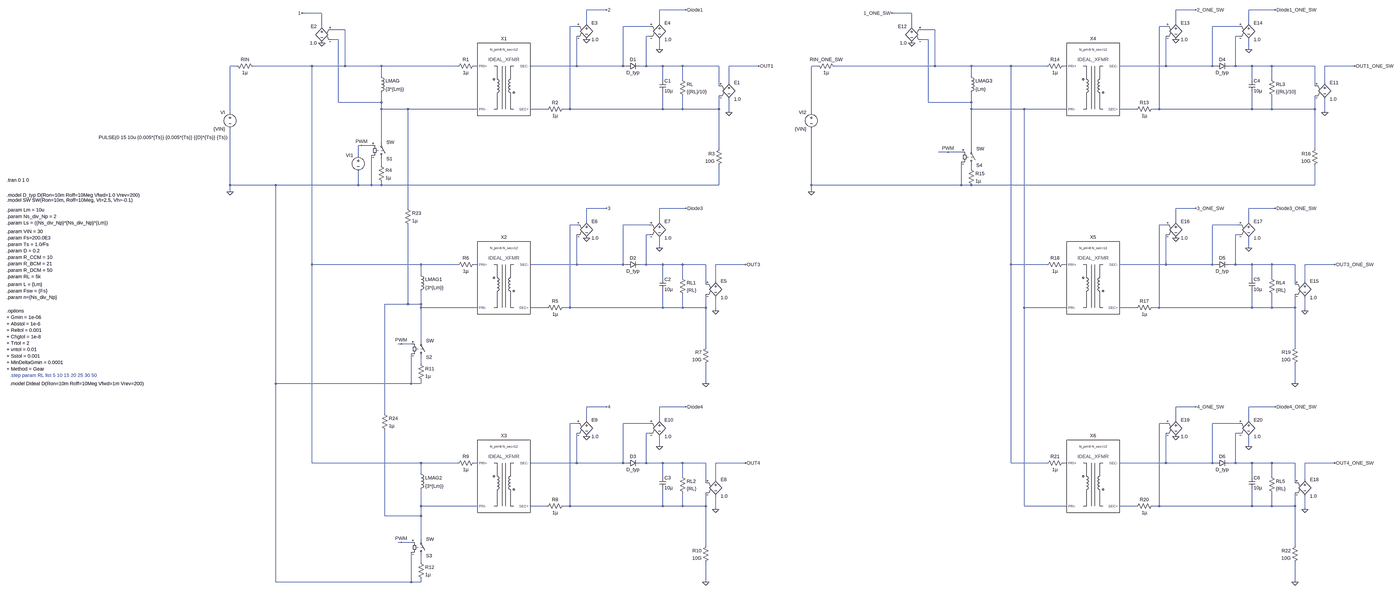
[diagram p0: schematic Flyback_Basic_Model_Multiple_Windings.asc, whole sheet]
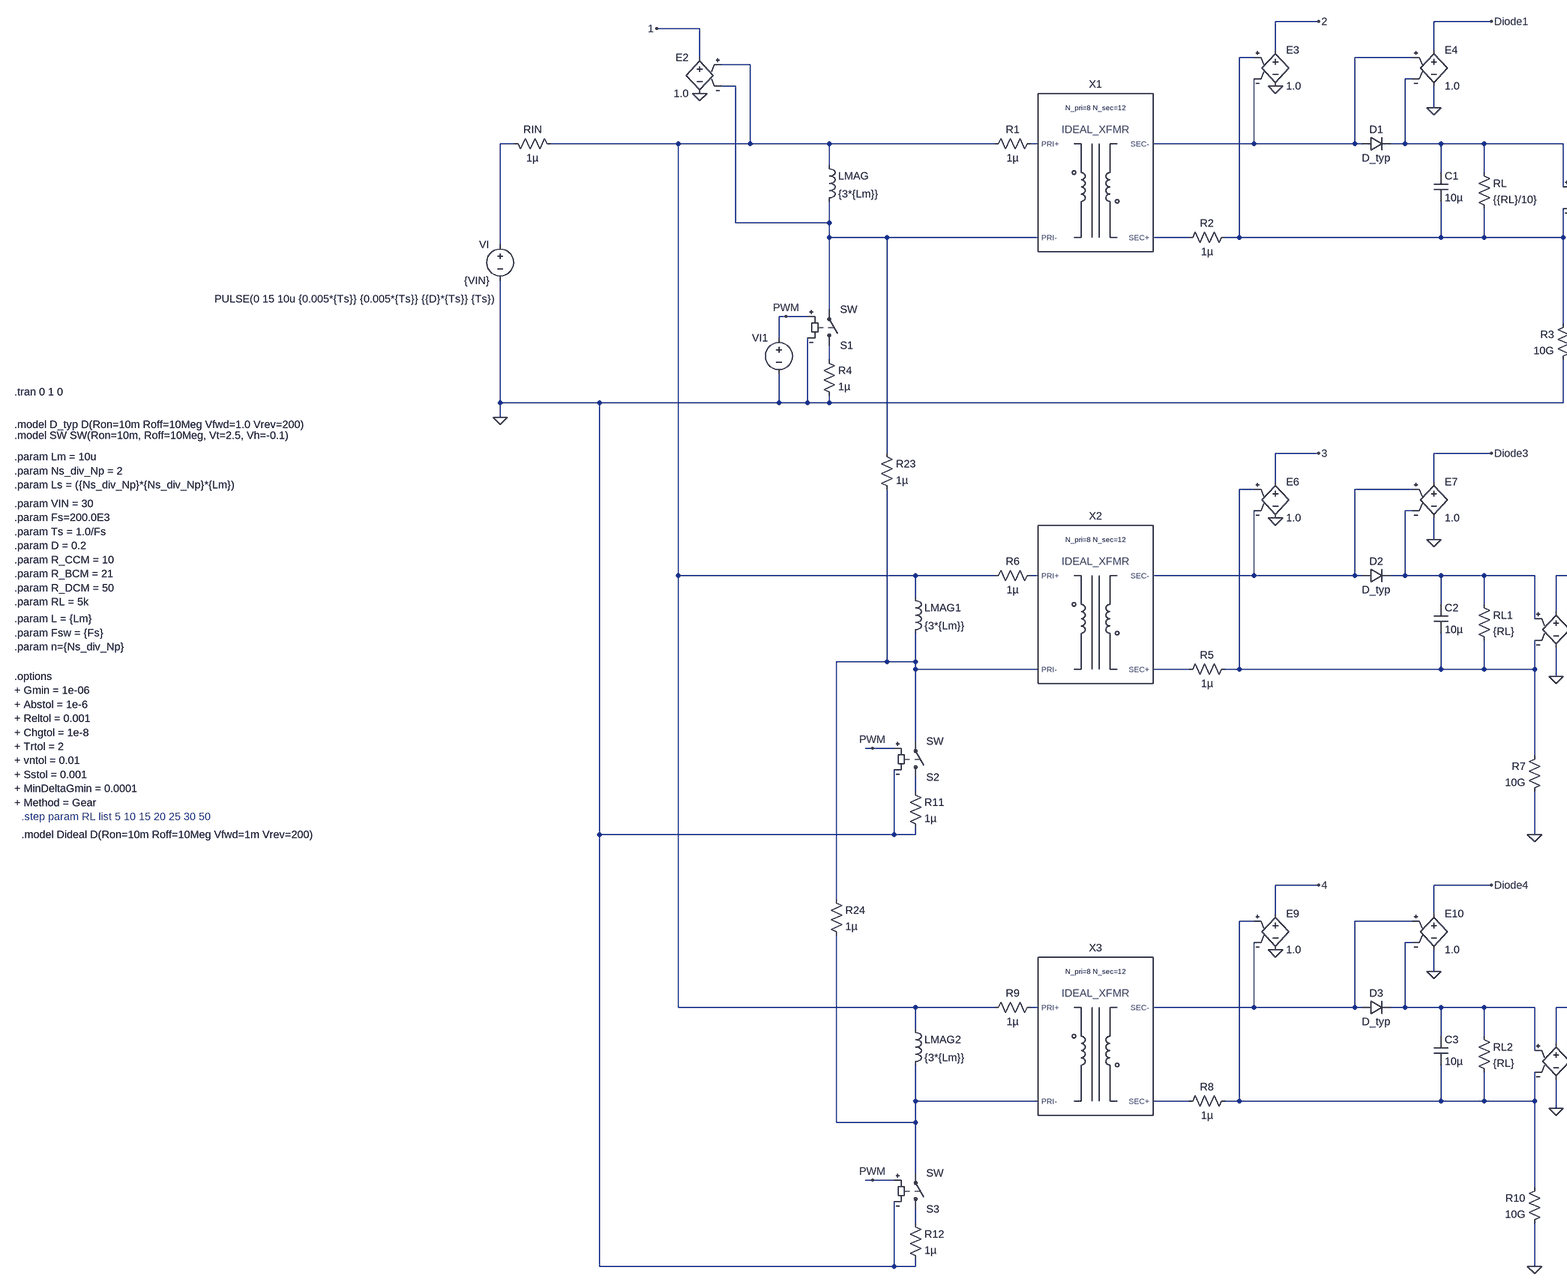
[diagram p1: schematic Flyback_Basic_Model_Multiple_Windings.asc, part, row 1 of 1, column 1 of 2]
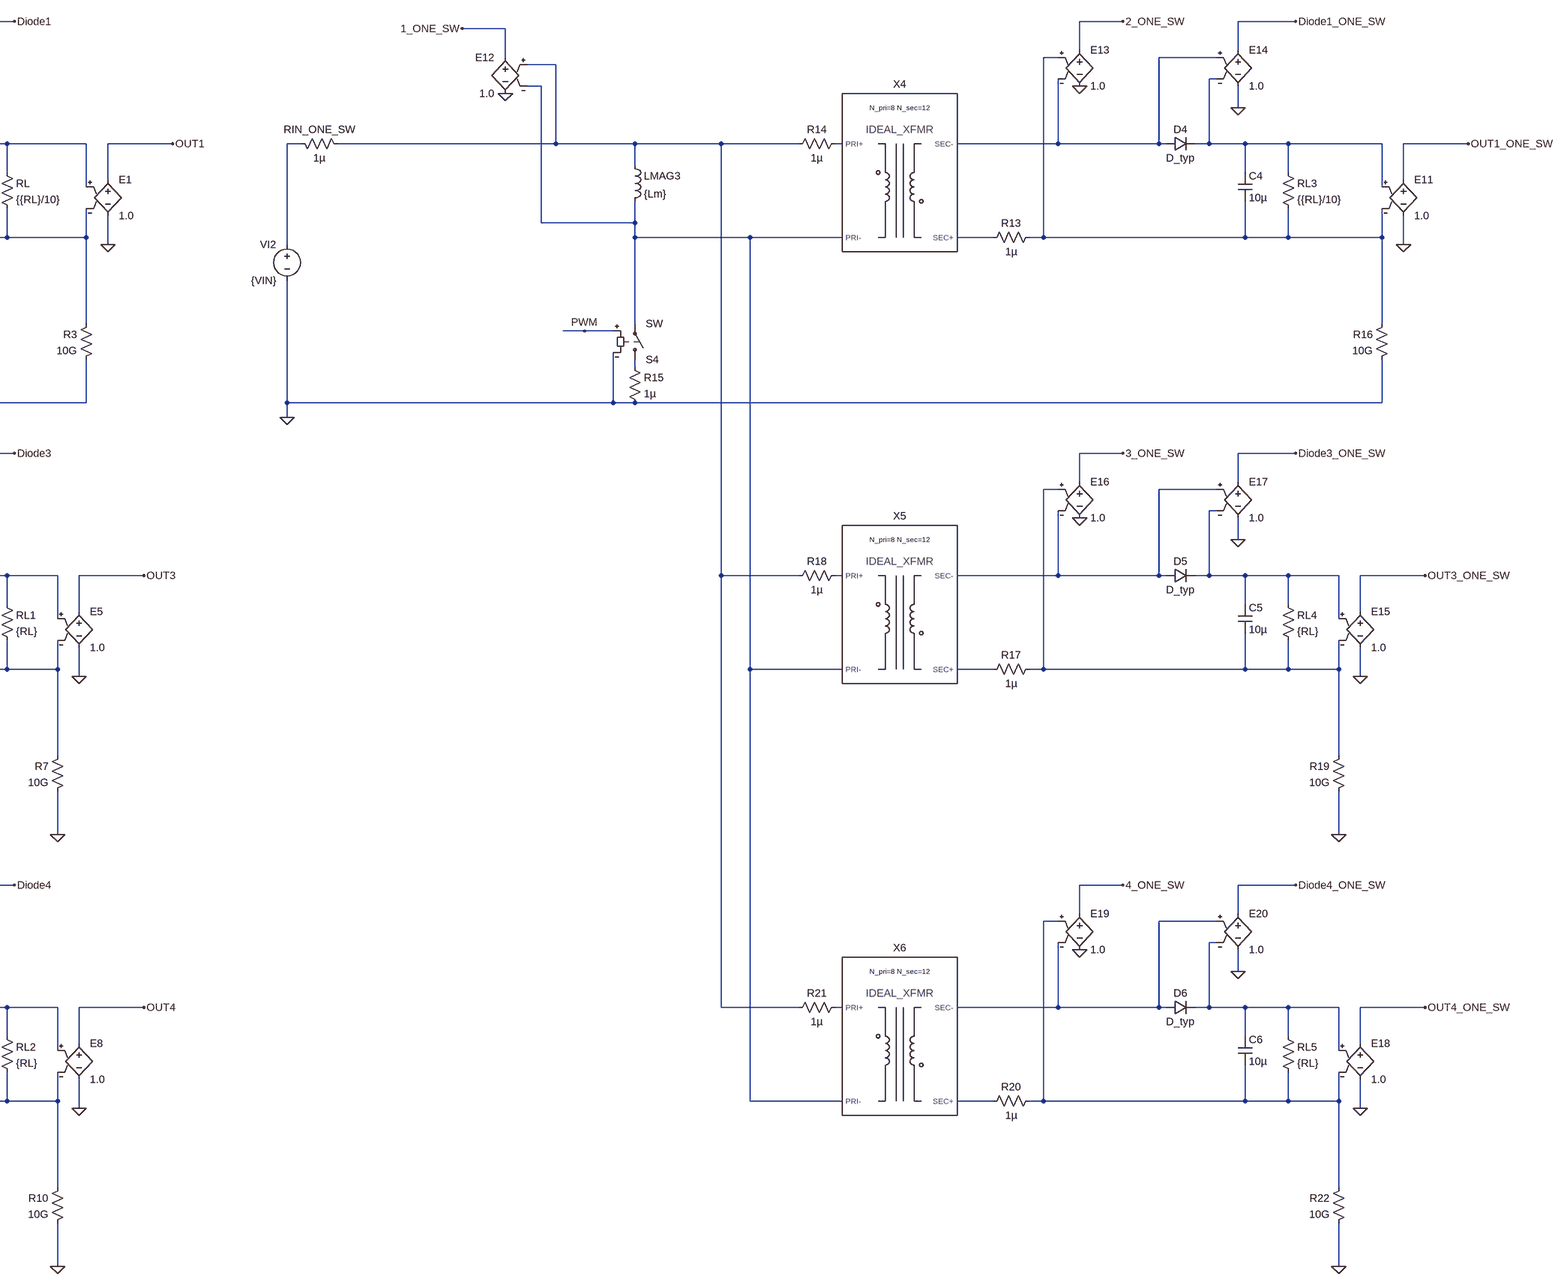
[diagram p2: schematic Flyback_Basic_Model_Multiple_Windings.asc, part, row 1 of 1, column 2 of 2]
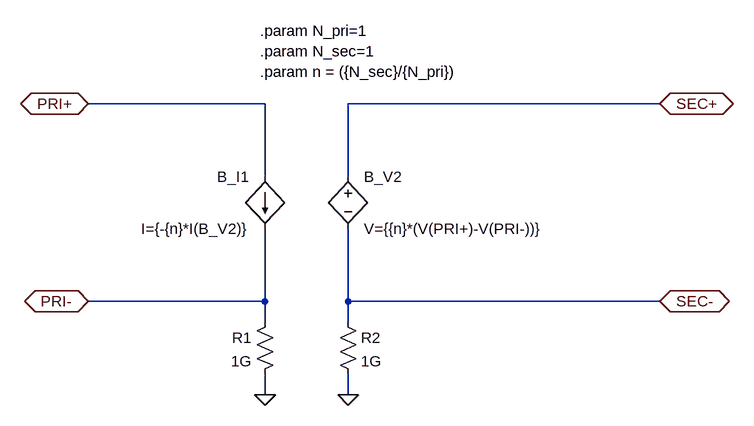
[diagram p3: sub-circuit ideal_dc_xfmr_alt.asc]
Flyback_Basic_Model_Multiple_Windings.asc, the LTspice schematic file:
Version 4.1
SHEET 1 4728 3524
WIRE 800 -288 704 -288
WIRE 1184 -288 1056 -288
WIRE 3760 -288 3664 -288
WIRE 4144 -288 4016 -288
WIRE -576 -272 -672 -272
WIRE 2384 -272 2288 -272
WIRE 704 -224 704 -288
WIRE 1056 -224 1056 -288
WIRE 3664 -224 3664 -288
WIRE 4016 -224 4016 -288
WIRE -576 -208 -576 -272
WIRE 656 -208 624 -208
WIRE 1008 -208 880 -208
WIRE 2384 -208 2384 -272
WIRE 3616 -208 3584 -208
WIRE 3968 -208 3840 -208
WIRE -464 -192 -528 -192
WIRE 2496 -192 2432 -192
WIRE 1008 -160 992 -160
WIRE 3968 -160 3952 -160
WIRE -496 -144 -528 -144
WIRE 2464 -144 2432 -144
WIRE 1056 -96 1056 -144
WIRE 4016 -96 4016 -144
WIRE -1056 -16 -1088 -16
WIRE -624 -16 -976 -16
WIRE -464 -16 -464 -192
WIRE -464 -16 -624 -16
WIRE -288 -16 -464 -16
WIRE 80 -16 -288 -16
WIRE 176 -16 160 -16
WIRE 656 -16 656 -160
WIRE 656 -16 432 -16
WIRE 880 -16 880 -208
WIRE 880 -16 656 -16
WIRE 896 -16 880 -16
WIRE 992 -16 992 -160
WIRE 992 -16 960 -16
WIRE 1072 -16 992 -16
WIRE 1168 -16 1072 -16
WIRE 1344 -16 1168 -16
WIRE 1536 -16 1392 -16
WIRE 1904 -16 1872 -16
WIRE 2496 -16 2496 -192
WIRE 2496 -16 1984 -16
WIRE 2672 -16 2496 -16
WIRE 2864 -16 2672 -16
WIRE 3040 -16 2864 -16
WIRE 3136 -16 3120 -16
WIRE 3616 -16 3616 -160
WIRE 3616 -16 3392 -16
WIRE 3840 -16 3840 -208
WIRE 3840 -16 3616 -16
WIRE 3856 -16 3840 -16
WIRE 3952 -16 3952 -160
WIRE 3952 -16 3920 -16
WIRE 4032 -16 3952 -16
WIRE 4128 -16 4032 -16
WIRE 4336 -16 4128 -16
WIRE 4528 -16 4384 -16
WIRE -288 32 -288 -16
WIRE 2672 32 2672 -16
WIRE 1072 48 1072 -16
WIRE 1168 48 1168 -16
WIRE 4032 48 4032 -16
WIRE 4128 48 4128 -16
WIRE 1392 64 1392 -16
WIRE 4384 64 4384 -16
WIRE 1344 80 1344 -16
WIRE 4336 80 4336 -16
WIRE -496 160 -496 -144
WIRE -288 160 -288 112
WIRE -288 160 -496 160
WIRE 2464 160 2464 -144
WIRE 2672 160 2672 112
WIRE 2672 160 2464 160
WIRE -288 192 -288 160
WIRE -160 192 -288 192
WIRE 176 192 -160 192
WIRE 512 192 432 192
WIRE 624 192 624 -208
WIRE 624 192 592 192
WIRE 1072 192 1072 112
WIRE 1072 192 624 192
WIRE 1168 192 1168 128
WIRE 1168 192 1072 192
WIRE 1344 192 1344 128
WIRE 1344 192 1168 192
WIRE 2672 192 2672 160
WIRE 2928 192 2672 192
WIRE 3136 192 2928 192
WIRE 3472 192 3392 192
WIRE 3584 192 3584 -208
WIRE 3584 192 3552 192
WIRE 4032 192 4032 112
WIRE 4032 192 3584 192
WIRE 4128 192 4128 128
WIRE 4128 192 4032 192
WIRE 4336 192 4336 128
WIRE 4336 192 4128 192
WIRE -1088 208 -1088 -16
WIRE 1392 208 1392 144
WIRE 1872 208 1872 -16
WIRE 4384 208 4384 144
WIRE -288 352 -288 192
WIRE -384 368 -400 368
WIRE -336 368 -384 368
WIRE 1344 384 1344 192
WIRE 2672 384 2672 192
WIRE 4336 384 4336 192
WIRE 2560 400 2512 400
WIRE 2624 400 2560 400
WIRE -400 416 -400 368
WIRE -288 464 -288 432
WIRE 2672 480 2672 464
WIRE -1088 560 -1088 288
WIRE -864 560 -1088 560
WIRE -400 560 -400 496
WIRE -400 560 -864 560
WIRE -336 560 -336 416
WIRE -336 560 -400 560
WIRE -288 560 -288 544
WIRE -288 560 -336 560
WIRE 1344 560 1344 464
WIRE 1344 560 -288 560
WIRE 1872 560 1872 288
WIRE 2624 560 2624 448
WIRE 2624 560 1872 560
WIRE 2672 560 2624 560
WIRE 4336 560 4336 464
WIRE 4336 560 2672 560
WIRE -1088 592 -1088 560
WIRE 1872 592 1872 560
WIRE -160 672 -160 192
WIRE 800 672 704 672
WIRE 1184 672 1056 672
WIRE 3760 672 3664 672
WIRE 4144 672 4016 672
WIRE 704 736 704 672
WIRE 1056 736 1056 672
WIRE 3664 736 3664 672
WIRE 4016 736 4016 672
WIRE 656 752 624 752
WIRE 1008 752 880 752
WIRE 3616 752 3584 752
WIRE 3968 752 3840 752
WIRE 1008 800 992 800
WIRE 3968 800 3952 800
WIRE 1056 864 1056 816
WIRE 4016 864 4016 816
WIRE -624 944 -624 -16
WIRE -96 944 -624 944
WIRE 80 944 -96 944
WIRE 176 944 160 944
WIRE 656 944 656 800
WIRE 656 944 432 944
WIRE 880 944 880 752
WIRE 880 944 656 944
WIRE 896 944 880 944
WIRE 992 944 992 800
WIRE 992 944 960 944
WIRE 1072 944 992 944
WIRE 1168 944 1072 944
WIRE 1280 944 1168 944
WIRE 1472 944 1328 944
WIRE 2864 944 2864 -16
WIRE 3040 944 2864 944
WIRE 3136 944 3120 944
WIRE 3616 944 3616 800
WIRE 3616 944 3392 944
WIRE 3840 944 3840 752
WIRE 3840 944 3616 944
WIRE 3856 944 3840 944
WIRE 3952 944 3952 800
WIRE 3952 944 3920 944
WIRE 4032 944 3952 944
WIRE 4128 944 4032 944
WIRE 4240 944 4128 944
WIRE 4432 944 4288 944
WIRE -96 992 -96 944
WIRE 1072 1008 1072 944
WIRE 1168 1008 1168 944
WIRE 4032 1008 4032 944
WIRE 4128 1008 4128 944
WIRE 1328 1024 1328 944
WIRE 4288 1024 4288 944
WIRE 1280 1040 1280 944
WIRE 4240 1040 4240 944
WIRE -160 1136 -160 752
WIRE -160 1136 -272 1136
WIRE -96 1136 -96 1072
WIRE -96 1136 -160 1136
WIRE -96 1152 -96 1136
WIRE 176 1152 -96 1152
WIRE 512 1152 432 1152
WIRE 624 1152 624 752
WIRE 624 1152 592 1152
WIRE 1072 1152 1072 1072
WIRE 1072 1152 624 1152
WIRE 1168 1152 1168 1088
WIRE 1168 1152 1072 1152
WIRE 1280 1152 1280 1088
WIRE 1280 1152 1168 1152
WIRE 2928 1152 2928 192
WIRE 3136 1152 2928 1152
WIRE 3472 1152 3392 1152
WIRE 3584 1152 3584 752
WIRE 3584 1152 3552 1152
WIRE 4032 1152 4032 1072
WIRE 4032 1152 3584 1152
WIRE 4128 1152 4128 1088
WIRE 4128 1152 4032 1152
WIRE 4240 1152 4240 1088
WIRE 4240 1152 4128 1152
WIRE 1328 1168 1328 1104
WIRE 4288 1168 4288 1104
WIRE -96 1312 -96 1152
WIRE -192 1328 -208 1328
WIRE -144 1328 -192 1328
WIRE 1280 1344 1280 1152
WIRE 4240 1344 4240 1152
WIRE -96 1424 -96 1392
WIRE -864 1520 -864 560
WIRE -144 1520 -144 1376
WIRE -144 1520 -864 1520
WIRE -96 1520 -96 1504
WIRE -96 1520 -144 1520
WIRE 1280 1520 1280 1424
WIRE 4240 1520 4240 1424
WIRE 800 1632 704 1632
WIRE 1184 1632 1056 1632
WIRE 3760 1632 3664 1632
WIRE 4144 1632 4016 1632
WIRE -272 1664 -272 1136
WIRE 704 1696 704 1632
WIRE 1056 1696 1056 1632
WIRE 3664 1696 3664 1632
WIRE 4016 1696 4016 1632
WIRE 656 1712 624 1712
WIRE 1008 1712 880 1712
WIRE 3616 1712 3584 1712
WIRE 3968 1712 3840 1712
WIRE 1008 1760 992 1760
WIRE 3968 1760 3952 1760
WIRE 1056 1824 1056 1776
WIRE 4016 1824 4016 1776
WIRE -624 1904 -624 944
WIRE -96 1904 -624 1904
WIRE 80 1904 -96 1904
WIRE 176 1904 160 1904
WIRE 656 1904 656 1760
WIRE 656 1904 432 1904
WIRE 880 1904 880 1712
WIRE 880 1904 656 1904
WIRE 896 1904 880 1904
WIRE 992 1904 992 1760
WIRE 992 1904 960 1904
WIRE 1072 1904 992 1904
WIRE 1168 1904 1072 1904
WIRE 1280 1904 1168 1904
WIRE 1472 1904 1328 1904
WIRE 2864 1904 2864 944
WIRE 3040 1904 2864 1904
WIRE 3136 1904 3120 1904
WIRE 3616 1904 3616 1760
WIRE 3616 1904 3392 1904
WIRE 3840 1904 3840 1712
WIRE 3840 1904 3616 1904
WIRE 3856 1904 3840 1904
WIRE 3952 1904 3952 1760
WIRE 3952 1904 3920 1904
WIRE 4032 1904 3952 1904
WIRE 4128 1904 4032 1904
WIRE 4240 1904 4128 1904
WIRE 4432 1904 4288 1904
WIRE -96 1952 -96 1904
WIRE 1072 1968 1072 1904
WIRE 1168 1968 1168 1904
WIRE 4032 1968 4032 1904
WIRE 4128 1968 4128 1904
WIRE 1328 1984 1328 1904
WIRE 4288 1984 4288 1904
WIRE 1280 2000 1280 1904
WIRE 4240 2000 4240 1904
WIRE -96 2112 -96 2032
WIRE 176 2112 -96 2112
WIRE 512 2112 432 2112
WIRE 624 2112 624 1712
WIRE 624 2112 592 2112
WIRE 1072 2112 1072 2032
WIRE 1072 2112 624 2112
WIRE 1168 2112 1168 2048
WIRE 1168 2112 1072 2112
WIRE 1280 2112 1280 2048
WIRE 1280 2112 1168 2112
WIRE 2928 2112 2928 1152
WIRE 3136 2112 2928 2112
WIRE 3472 2112 3392 2112
WIRE 3584 2112 3584 1712
WIRE 3584 2112 3552 2112
WIRE 4032 2112 4032 2032
WIRE 4032 2112 3584 2112
WIRE 4128 2112 4128 2048
WIRE 4128 2112 4032 2112
WIRE 4240 2112 4240 2048
WIRE 4240 2112 4128 2112
WIRE 1328 2128 1328 2064
WIRE 4288 2128 4288 2064
WIRE -272 2160 -272 1744
WIRE -96 2160 -96 2112
WIRE -96 2160 -272 2160
WIRE -96 2272 -96 2160
WIRE -192 2288 -208 2288
WIRE -144 2288 -192 2288
WIRE 1280 2304 1280 2112
WIRE 4240 2304 4240 2112
WIRE -96 2384 -96 2352
WIRE -864 2480 -864 1520
WIRE -144 2480 -144 2336
WIRE -144 2480 -864 2480
WIRE -96 2480 -96 2464
WIRE -96 2480 -144 2480
WIRE 1280 2480 1280 2384
WIRE 4240 2480 4240 2384
FLAG -1088 592 0
FLAG 1392 208 0
FLAG 1536 -16 OUT1
FLAG -576 -128 0
FLAG 704 -144 0
FLAG -672 -272 1
FLAG 800 -288 2
FLAG 1056 -96 0
FLAG 1184 -288 Diode1
FLAG -384 368 PWM
FLAG 1328 1168 0
FLAG 1472 944 OUT3
FLAG 704 816 0
FLAG 800 672 3
FLAG 1056 864 0
FLAG 1184 672 Diode3
FLAG 1328 2128 0
FLAG 1472 1904 OUT4
FLAG 704 1776 0
FLAG 800 1632 4
FLAG 1056 1824 0
FLAG 1184 1632 Diode4
FLAG 1280 1520 0
FLAG 1280 2480 0
FLAG -192 1328 PWM
FLAG -192 2288 PWM
FLAG 1872 592 0
FLAG 4384 208 0
FLAG 4528 -16 OUT1_ONE_SW
FLAG 2384 -128 0
FLAG 3664 -144 0
FLAG 2288 -272 1_ONE_SW
FLAG 3760 -288 2_ONE_SW
FLAG 4016 -96 0
FLAG 4144 -288 Diode1_ONE_SW
FLAG 4288 1168 0
FLAG 4432 944 OUT3_ONE_SW
FLAG 3664 816 0
FLAG 3760 672 3_ONE_SW
FLAG 4016 864 0
FLAG 4144 672 Diode3_ONE_SW
FLAG 4288 2128 0
FLAG 4432 1904 OUT4_ONE_SW
FLAG 3664 1776 0
FLAG 3760 1632 4_ONE_SW
FLAG 4016 1824 0
FLAG 4144 1632 Diode4_ONE_SW
FLAG 4240 1520 0
FLAG 4240 2480 0
FLAG 2560 400 PWM
SYMBOL voltage -1088 192 M0
WINDOW 123 0 0 Left 0
WINDOW 39 0 0 Left 0
SYMATTR InstName VI
SYMATTR Value {VIN}
SYMBOL voltage -400 400 M0
WINDOW 123 0 0 Left 0
WINDOW 39 0 0 Left 0
WINDOW 3 701 -71 Left 2
SYMATTR Value PULSE(0 15 10u {0.005*{Ts}} {0.005*{Ts}} {{D}*{Ts}} {Ts})
SYMATTR InstName VI1
SYMBOL res 1152 32 R0
SYMATTR InstName RL
SYMATTR Value {{RL}/10}
SYMBOL cap 1056 48 R0
SYMATTR InstName C1
SYMATTR Value 10µ
SYMBOL diode 896 0 R270
WINDOW 0 32 32 VTop 2
WINDOW 3 0 32 VBottom 2
SYMATTR InstName D1
SYMATTR Value D_typ
SYMBOL e 1392 48 R0
SYMATTR InstName E1
SYMATTR Value 1.0
SYMBOL res 608 176 R90
WINDOW 0 0 56 VBottom 2
WINDOW 3 32 56 VTop 2
SYMATTR InstName R2
SYMATTR Value 1µ
SYMBOL res 64 0 R270
WINDOW 0 32 56 VTop 2
WINDOW 3 0 56 VBottom 2
SYMATTR InstName R1
SYMATTR Value 1µ
SYMBOL e -576 -224 M0
SYMATTR InstName E2
SYMATTR Value 1.0
SYMBOL e 704 -240 R0
SYMATTR InstName E3
SYMATTR Value 1.0
SYMBOL sw -288 448 M180
SYMATTR InstName S1
SYMBOL res -304 448 R0
SYMATTR InstName R4
SYMATTR Value 1µ
SYMBOL e 1056 -240 R0
SYMATTR InstName E4
SYMATTR Value 1.0
SYMBOL IDEAL_DC_XFMR_ALT 304 80 R0
WINDOW 39 0 -176 Center 1
SYMATTR SpiceLine N_pri=8 N_sec=12
SYMATTR InstName X1
SYMBOL ind -304 16 R0
SYMATTR InstName LMAG
SYMATTR Value {3*{Lm}}
SYMBOL res 1360 368 M0
SYMATTR InstName R3
SYMATTR Value 10G
SYMBOL res 1152 992 R0
SYMATTR InstName RL1
SYMATTR Value {RL}
SYMBOL cap 1056 1008 R0
SYMATTR InstName C2
SYMATTR Value 10µ
SYMBOL diode 896 960 R270
WINDOW 0 32 32 VTop 2
WINDOW 3 0 32 VBottom 2
SYMATTR InstName D2
SYMATTR Value D_typ
SYMBOL e 1328 1008 R0
SYMATTR InstName E5
SYMATTR Value 1.0
SYMBOL res 608 1136 R90
WINDOW 0 0 56 VBottom 2
WINDOW 3 32 56 VTop 2
SYMATTR InstName R5
SYMATTR Value 1µ
SYMBOL res 64 960 R270
WINDOW 0 32 56 VTop 2
WINDOW 3 0 56 VBottom 2
SYMATTR InstName R6
SYMATTR Value 1µ
SYMBOL e 704 720 R0
SYMATTR InstName E6
SYMATTR Value 1.0
SYMBOL e 1056 720 R0
SYMATTR InstName E7
SYMATTR Value 1.0
SYMBOL IDEAL_DC_XFMR_ALT 304 1040 R0
WINDOW 39 0 -176 Center 1
SYMATTR SpiceLine N_pri=8 N_sec=12
SYMATTR InstName X2
SYMBOL res 1296 1328 M0
SYMATTR InstName R7
SYMATTR Value 10G
SYMBOL res 1152 1952 R0
SYMATTR InstName RL2
SYMATTR Value {RL}
SYMBOL cap 1056 1968 R0
SYMATTR InstName C3
SYMATTR Value 10µ
SYMBOL diode 896 1920 R270
WINDOW 0 32 32 VTop 2
WINDOW 3 0 32 VBottom 2
SYMATTR InstName D3
SYMATTR Value D_typ
SYMBOL e 1328 1968 R0
SYMATTR InstName E8
SYMATTR Value 1.0
SYMBOL res 608 2096 R90
WINDOW 0 0 56 VBottom 2
WINDOW 3 32 56 VTop 2
SYMATTR InstName R8
SYMATTR Value 1µ
SYMBOL res 64 1920 R270
WINDOW 0 32 56 VTop 2
WINDOW 3 0 56 VBottom 2
SYMATTR InstName R9
SYMATTR Value 1µ
SYMBOL e 704 1680 R0
SYMATTR InstName E9
SYMATTR Value 1.0
SYMBOL e 1056 1680 R0
SYMATTR InstName E10
SYMATTR Value 1.0
SYMBOL IDEAL_DC_XFMR_ALT 304 2000 R0
WINDOW 39 0 -176 Center 1
SYMATTR SpiceLine N_pri=8 N_sec=12
SYMATTR InstName X3
SYMBOL res 1296 2288 M0
SYMATTR InstName R10
SYMATTR Value 10G
SYMBOL sw -96 1408 M180
SYMATTR InstName S2
SYMBOL res -112 1408 R0
SYMATTR InstName R11
SYMATTR Value 1µ
SYMBOL ind -112 976 R0
SYMATTR InstName LMAG1
SYMATTR Value {3*{Lm}}
SYMBOL sw -96 2368 M180
SYMATTR InstName S3
SYMBOL res -112 2368 R0
SYMATTR InstName R12
SYMATTR Value 1µ
SYMBOL ind -112 1936 R0
SYMATTR InstName LMAG2
SYMATTR Value {3*{Lm}}
SYMBOL res -1072 -32 M90
WINDOW 0 0 56 VBottom 2
WINDOW 3 32 56 VTop 2
SYMATTR InstName RIN
SYMATTR Value 1µ
SYMBOL voltage 1872 192 M0
WINDOW 123 0 0 Left 0
WINDOW 39 0 0 Left 0
SYMATTR InstName VI2
SYMATTR Value {VIN}
SYMBOL res 4112 32 R0
SYMATTR InstName RL3
SYMATTR Value {{RL}/10}
SYMBOL cap 4016 48 R0
SYMATTR InstName C4
SYMATTR Value 10µ
SYMBOL diode 3856 0 R270
WINDOW 0 32 32 VTop 2
WINDOW 3 0 32 VBottom 2
SYMATTR InstName D4
SYMATTR Value D_typ
SYMBOL e 4384 48 R0
SYMATTR InstName E11
SYMATTR Value 1.0
SYMBOL res 3568 176 R90
WINDOW 0 0 56 VBottom 2
WINDOW 3 32 56 VTop 2
SYMATTR InstName R13
SYMATTR Value 1µ
SYMBOL res 3024 0 R270
WINDOW 0 32 56 VTop 2
WINDOW 3 0 56 VBottom 2
SYMATTR InstName R14
SYMATTR Value 1µ
SYMBOL e 2384 -224 M0
SYMATTR InstName E12
SYMATTR Value 1.0
SYMBOL e 3664 -240 R0
SYMATTR InstName E13
SYMATTR Value 1.0
SYMBOL sw 2672 480 M180
SYMATTR InstName S4
SYMBOL res 2656 464 R0
SYMATTR InstName R15
SYMATTR Value 1µ
SYMBOL e 4016 -240 R0
SYMATTR InstName E14
SYMATTR Value 1.0
SYMBOL IDEAL_DC_XFMR_ALT 3264 80 R0
WINDOW 39 0 -176 Center 1
SYMATTR SpiceLine N_pri=8 N_sec=12
SYMATTR InstName X4
SYMBOL ind 2656 16 R0
SYMATTR InstName LMAG3
SYMATTR Value {Lm}
SYMATTR SpiceLine Rser=1m
SYMBOL res 4352 368 M0
SYMATTR InstName R16
SYMATTR Value 10G
SYMBOL res 4112 992 R0
SYMATTR InstName RL4
SYMATTR Value {RL}
SYMBOL cap 4016 1008 R0
SYMATTR InstName C5
SYMATTR Value 10µ
SYMBOL diode 3856 960 R270
WINDOW 0 32 32 VTop 2
WINDOW 3 0 32 VBottom 2
SYMATTR InstName D5
SYMATTR Value D_typ
SYMBOL e 4288 1008 R0
SYMATTR InstName E15
SYMATTR Value 1.0
SYMBOL res 3568 1136 R90
WINDOW 0 0 56 VBottom 2
WINDOW 3 32 56 VTop 2
SYMATTR InstName R17
SYMATTR Value 1µ
SYMBOL res 3024 960 R270
WINDOW 0 32 56 VTop 2
WINDOW 3 0 56 VBottom 2
SYMATTR InstName R18
SYMATTR Value 1µ
SYMBOL e 3664 720 R0
SYMATTR InstName E16
SYMATTR Value 1.0
SYMBOL e 4016 720 R0
SYMATTR InstName E17
SYMATTR Value 1.0
SYMBOL IDEAL_DC_XFMR_ALT 3264 1040 R0
WINDOW 39 0 -176 Center 1
SYMATTR SpiceLine N_pri=8 N_sec=12
SYMATTR InstName X5
SYMBOL res 4256 1328 M0
SYMATTR InstName R19
SYMATTR Value 10G
SYMBOL res 4112 1952 R0
SYMATTR InstName RL5
SYMATTR Value {RL}
SYMBOL cap 4016 1968 R0
SYMATTR InstName C6
SYMATTR Value 10µ
SYMBOL diode 3856 1920 R270
WINDOW 0 32 32 VTop 2
WINDOW 3 0 32 VBottom 2
SYMATTR InstName D6
SYMATTR Value D_typ
SYMBOL e 4288 1968 R0
SYMATTR InstName E18
SYMATTR Value 1.0
SYMBOL res 3568 2096 R90
WINDOW 0 0 56 VBottom 2
WINDOW 3 32 56 VTop 2
SYMATTR InstName R20
SYMATTR Value 1µ
SYMBOL res 3024 1920 R270
WINDOW 0 32 56 VTop 2
WINDOW 3 0 56 VBottom 2
SYMATTR InstName R21
SYMATTR Value 1µ
SYMBOL e 3664 1680 R0
SYMATTR InstName E19
SYMATTR Value 1.0
SYMBOL e 4016 1680 R0
SYMATTR InstName E20
SYMATTR Value 1.0
SYMBOL IDEAL_DC_XFMR_ALT 3264 2000 R0
WINDOW 39 0 -176 Center 1
SYMATTR SpiceLine N_pri=8 N_sec=12
SYMATTR InstName X6
SYMBOL res 4256 2288 M0
SYMATTR InstName R22
SYMATTR Value 10G
SYMBOL res 1888 -32 M90
WINDOW 0 0 56 VBottom 2
WINDOW 3 32 56 VTop 2
SYMATTR InstName RIN_ONE_SW
SYMATTR Value 1µ
SYMBOL res -176 656 R0
SYMATTR InstName R23
SYMATTR Value 1µ
SYMBOL res -288 1648 R0
SYMATTR InstName R24
SYMATTR Value 1µ
TEXT -2168 536 Left 2 !.tran 0 1 0
TEXT -2168 632 Left 2 !.model SW SW(Ron=10m, Roff=10Meg, Vt=2.5, Vh=-0.1)
TEXT -2168 784 Left 2 !.param VIN = 30\n.param Fs=200.0E3\n.param Ts = 1.0/Fs\n.param D = 0.2\n.param R_CCM = 10\n.param R_BCM = 21\n.param R_DCM = 50\n.param RL = 5k
TEXT -2168 608 Left 2 !.model D_typ D(Ron=10m Roff=10Meg Vfwd=1.0 Vrev=200)
TEXT -2168 680 Left 2 !.param Lm = 10u\n.param Ns_div_Np = 2\n.param Ls = ({Ns_div_Np}*{Ns_div_Np}*{Lm})
TEXT -2168 1040 Left 2 !.param L = {Lm}\n.param Fsw = {Fs}\n.param n={Ns_div_Np}
TEXT -2152 1520 Left 2 !.model Dideal D(Ron=10m Roff=10Meg Vfwd=1m Vrev=200)
TEXT -2168 1168 Left 2 !.options\n+ Gmin = 1e-06\n+ Abstol = 1e-6\n+ Reltol = 0.001\n+ Chgtol = 1e-8\n+ Trtol = 2\n+ vntol = 0.01\n+ Sstol = 0.001\n+ MinDeltaGmin = 0.0001\n+ Method = Gear
TEXT -2152 1480 Left 2 ;.step param RL list 5 10 15 20 25 30 50

ideal_dc_xfmr_alt.asc, the sub-circuit schematic file:
Version 4.1
SHEET 1 996 680
WIRE 192 112 -80 112
WIRE 800 112 320 112
WIRE 192 224 192 112
WIRE 320 224 320 112
WIRE 192 416 192 304
WIRE 192 416 -80 416
WIRE 320 416 320 304
WIRE 800 416 320 416
WIRE 192 448 192 416
WIRE 320 448 320 416
WIRE 192 560 192 528
WIRE 320 560 320 528
FLAG -80 112 PRI+
IOPIN -80 112 BiDir
FLAG -80 416 PRI-
IOPIN -80 416 BiDir
FLAG 800 112 SEC+
IOPIN 800 112 BiDir
FLAG 800 416 SEC-
IOPIN 800 416 BiDir
FLAG 320 560 0
FLAG 192 560 0
SYMBOL bv 320 208 R0
SYMATTR InstName B_V2
SYMATTR Value V={{n}*(V(PRI+)-V(PRI-))}
SYMBOL bi 192 224 M0
SYMATTR InstName B_I1
SYMATTR Value I={-{n}*I(B_V2)}
SYMBOL res 208 432 M0
SYMATTR InstName R1
SYMATTR Value 1G
SYMBOL res 304 432 R0
SYMATTR InstName R2
SYMATTR Value 1G
TEXT 184 0 Left 2 !.param N_pri=1\n.param N_sec=1\n.param n = ({N_sec}/{N_pri})

The netlist it stands for:
* Flyback_Basic_Model_Multiple_Windings.asc
VI N011 0 {VIN}
VI1 PWM 0 PULSE(0 15 10u {0.005*{Ts}} {0.005*{Ts}} {{D}*{Ts}} {Ts})
RL N007 N001 {{RL}/10}
C1 N007 N001 10µ
D1 N002 N007 D_typ
E1 OUT1 0 N007 N001 1.0
R2 N001 N015 1µ
R1 N005 N012 1µ
E2 1 0 N005 N009 1.0
E3 2 0 N001 N002 1.0
S1 N017 N009 PWM 0 SW
R4 N017 0 1µ
E4 Diode1 0 N002 N007 1.0
X§X1 N012 N009 N015 N002 ideal_dc_xfmr_alt params: N_pri=8 N_sec=12
LMAG N005 N009 {3*{Lm}}
R3 N001 0 10G
RL1 N023 N019 {RL}
C2 N023 N019 10µ
D2 N020 N023 D_typ
E5 OUT3 0 N023 N019 1.0
R5 N019 N028 1µ
R6 N005 N025 1µ
E6 3 0 N019 N020 1.0
E7 Diode3 0 N020 N023 1.0
X§X2 N025 N027 N028 N020 ideal_dc_xfmr_alt params: N_pri=8 N_sec=12
R7 N019 0 10G
RL2 N035 N031 {RL}
C3 N035 N031 10µ
D3 N032 N035 D_typ
E8 OUT4 0 N035 N031 1.0
R8 N031 N040 1µ
R9 N005 N037 1µ
E9 4 0 N031 N032 1.0
E10 Diode4 0 N032 N035 1.0
X§X3 N037 N039 N040 N032 ideal_dc_xfmr_alt params: N_pri=8 N_sec=12
R10 N031 0 10G
S2 N030 N027 PWM 0 SW
R11 N030 0 1µ
LMAG1 N005 N027 {3*{Lm}}
S3 N042 N039 PWM 0 SW
R12 N042 0 1µ
LMAG2 N005 N039 {3*{Lm}}
RIN N011 N005 1µ
VI2 N013 0 {VIN}
RL3 N008 N003 {{RL}/10}
C4 N008 N003 10µ
D4 N004 N008 D_typ
E11 OUT1_ONE_SW 0 N008 N003 1.0
R13 N003 N016 1µ
R14 N006 N014 1µ
E12 1_ONE_SW 0 N006 N010 1.0
E13 2_ONE_SW 0 N003 N004 1.0
S4 N018 N010 PWM 0 SW
R15 N018 0 1µ
E14 Diode1_ONE_SW 0 N004 N008 1.0
X§X4 N014 N010 N016 N004 ideal_dc_xfmr_alt params: N_pri=8 N_sec=12
LMAG3 N006 N010 {Lm} Rser=1m
R16 N003 0 10G
RL4 N024 N021 {RL}
C5 N024 N021 10µ
D5 N022 N024 D_typ
E15 OUT3_ONE_SW 0 N024 N021 1.0
R17 N021 N029 1µ
R18 N006 N026 1µ
E16 3_ONE_SW 0 N021 N022 1.0
E17 Diode3_ONE_SW 0 N022 N024 1.0
X§X5 N026 N010 N029 N022 ideal_dc_xfmr_alt params: N_pri=8 N_sec=12
R19 N021 0 10G
RL5 N036 N033 {RL}
C6 N036 N033 10µ
D6 N034 N036 D_typ
E18 OUT4_ONE_SW 0 N036 N033 1.0
R20 N033 N041 1µ
R21 N006 N038 1µ
E19 4_ONE_SW 0 N033 N034 1.0
E20 Diode4_ONE_SW 0 N034 N036 1.0
X§X6 N038 N010 N041 N034 ideal_dc_xfmr_alt params: N_pri=8 N_sec=12
R22 N033 0 10G
RIN_ONE_SW N013 N006 1µ
R23 N009 N027 1µ
R24 N027 N039 1µ

* block symbol definitions
.subckt ideal_dc_xfmr_alt PRI+ PRI- SEC+ SEC-
B_V2 SEC+ SEC- V={{n}*(V(PRI+)-V(PRI-))}
B_I1 PRI+ PRI- I={-{n}*I(B_V2)}
R1 PRI- 0 1G
R2 SEC- 0 1G
.param N_pri=1
.param N_sec=1
.param n = ({N_sec}/{N_pri})
.ends ideal_dc_xfmr_alt

.model D D
.lib standard.dio
.tran 0 1 0
.model SW SW(Ron=10m, Roff=10Meg, Vt=2.5, Vh=-0.1)
.param VIN = 30
.param Fs=200.0E3
.param Ts = 1.0/Fs
.param D = 0.2
.param R_CCM = 10
.param R_BCM = 21
.param R_DCM = 50
.param RL = 5k
.model D_typ D(Ron=10m Roff=10Meg Vfwd=1.0 Vrev=200)
.param Lm = 10u
.param Ns_div_Np = 2
.param Ls = ({Ns_div_Np}*{Ns_div_Np}*{Lm})
.param L = {Lm}
.param Fsw = {Fs}
.param n={Ns_div_Np}
.model Dideal D(Ron=10m Roff=10Meg Vfwd=1m Vrev=200)
.options
+ Gmin = 1e-06
+ Abstol = 1e-6
+ Reltol = 0.001
+ Chgtol = 1e-8
+ Trtol = 2
+ vntol = 0.01
+ Sstol = 0.001
+ MinDeltaGmin = 0.0001
+ Method = Gear
* .step param RL list 5 10 15 20 25 30 50
.backanno
.end